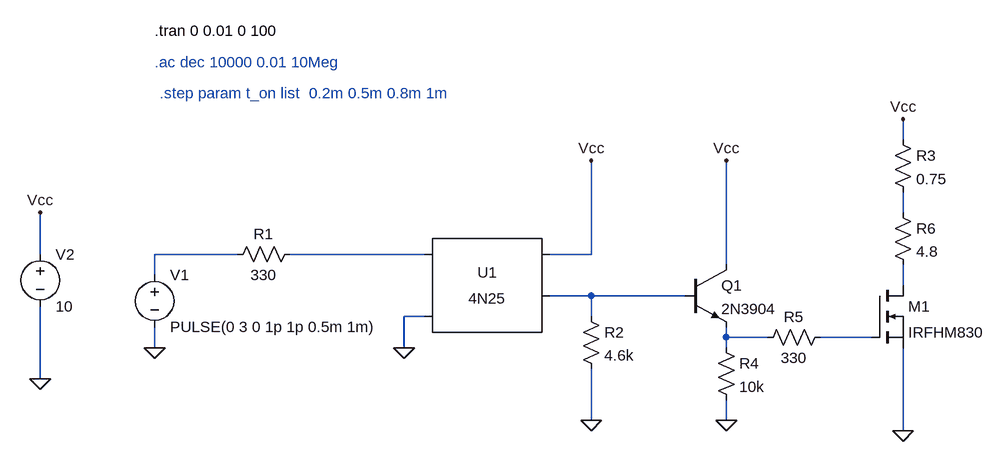
[diagram p0: schematic calibracion_sensor_realimentacion.asc]
calibracion_sensor_realimentacion.asc, the LTspice schematic file:
Version 4.1
SHEET 1 2112 1800
WIRE 1248 -112 1248 -144
WIRE 1248 0 1248 -32
WIRE -80 64 -80 0
WIRE 224 64 96 64
WIRE 512 64 304 64
WIRE 768 64 768 -80
WIRE 768 64 704 64
WIRE 976 80 976 -80
WIRE 96 96 96 64
WIRE 1248 112 1248 80
WIRE 768 128 704 128
WIRE 912 128 768 128
WIRE 512 160 480 160
WIRE 768 160 768 128
WIRE 976 192 976 176
WIRE 1040 192 976 192
WIRE 1200 192 1120 192
WIRE 96 208 96 176
WIRE 480 208 480 160
WIRE 976 208 976 192
WIRE -80 256 -80 144
WIRE 768 320 768 240
WIRE 976 320 976 288
WIRE 1248 336 1248 208
FLAG 96 208 0
FLAG 480 208 0
FLAG 768 -80 Vcc
FLAG 768 320 0
FLAG 976 -80 Vcc
FLAG 976 320 0
FLAG 1248 336 0
FLAG 1248 -144 Vcc
FLAG -80 0 Vcc
FLAG -80 256 0
SYMBOL voltage 96 80 R0
WINDOW 123 0 0 Left 0
WINDOW 39 0 0 Left 0
SYMATTR InstName V1
SYMATTR Value PULSE(0 3 0 1p 1p 0.5m 1m)
SYMBOL res 320 48 R90
WINDOW 0 0 56 VBottom 2
WINDOW 3 32 56 VTop 2
SYMATTR InstName R1
SYMATTR Value 330
SYMBOL Optos\\4N25 608 128 R0
SYMATTR InstName U1
SYMBOL res 752 144 R0
SYMATTR InstName R2
SYMATTR Value 4.6k
SYMBOL npn 912 80 R0
SYMATTR InstName Q1
SYMATTR Value 2N3904
SYMBOL res 960 192 R0
SYMATTR InstName R4
SYMATTR Value 10k
SYMBOL res 1136 176 R90
WINDOW 0 0 56 VBottom 2
WINDOW 3 32 56 VTop 2
SYMATTR InstName R5
SYMATTR Value 330
SYMBOL nmos 1200 112 R0
SYMATTR InstName M1
SYMATTR Value IRFHM830
SYMBOL res 1232 -16 R0
SYMATTR InstName R6
SYMATTR Value 4.8
SYMBOL voltage -80 48 R0
WINDOW 123 0 0 Left 0
WINDOW 39 0 0 Left 0
SYMATTR InstName V2
SYMATTR Value 10
SYMBOL res 1232 -128 R0
SYMATTR InstName R3
SYMATTR Value 0.75
TEXT 96 -280 Left 2 !.tran 0 0.01 0 100
TEXT 96 -232 Left 2 ;.ac dec 10000 0.01 10Meg
TEXT 104 -184 Left 2 ;.step param t_on list  0.2m 0.5m 0.8m 1m

The netlist it stands for:
* calibracion_sensor_realimentacion.asc
V1 N002 0 PULSE(0 3 0 1p 1p 0.5m 1m)
R1 N003 N002 330
X§U1 N003 0 Vcc N005 NC_01 4N25
R2 N005 0 4.6k
Q1 Vcc N005 N006 0 2N3904
R4 N006 0 10k
R5 N007 N006 330
M1 N004 N007 0 0 IRFHM830
R6 N001 N004 4.8
V2 Vcc 0 10
R3 Vcc N001 0.75
.model NPN NPN
.model PNP PNP
.lib standard.bjt
.model NMOS NMOS
.model PMOS PMOS
.lib standard.mos
.tran 0 0.01 0 100
* .ac dec 10000 0.01 10Meg
* .step param t_on list  0.2m 0.5m 0.8m 1m
.lib 4N25.sub
.backanno
.end